# Altium schematic sheet Proj04.SchDoc
size A; SheetNumber: 1; SheetTotal: 1
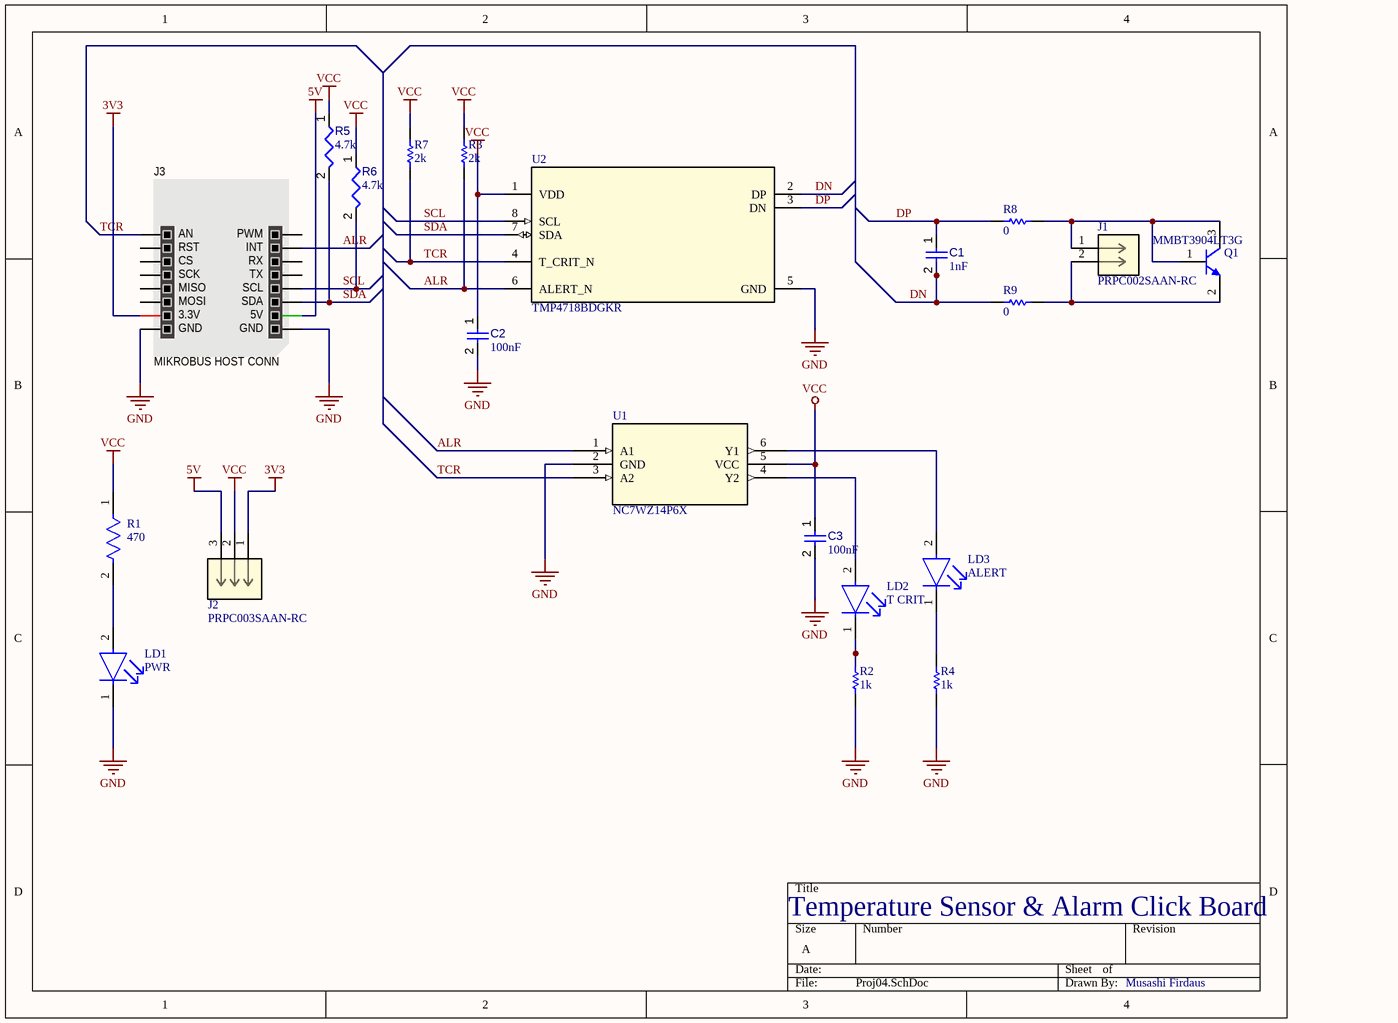
[diagram p0: Proj04.SchDoc]

## Parts
C1  value 1nF  [CAPC3216X190X55LL30T25]  (hidden comment: Capacitor 100 uF +/- 20% 6.3 V 1206)
C2  value 100nF  [CAPC3216X190X55LL30T25]  (hidden comment: Capacitor 100 uF +/- 20% 6.3 V 1206)
C3  value 100nF  [CAPC3216X190X55LL30T25]  (hidden comment: Capacitor 100 uF +/- 20% 6.3 V 1206)
J1  PRPC002SAAN-RC  [CONN_PRPC002SAAN-RC_SUL]
J2  PRPC003SAAN-RC  [CONN_PRPC003SAAN-RC_SUL]
J3  MIKROBUS HOST CONN  [MIKROBUS HOST CONN 8gen TH]
LD1  PWR  [FP-LTST-C150KRKT-MFG]
LD2  T CRIT  [FP-LTST-C150KRKT-MFG]
LD3  ALERT  [FP-LTST-C150KSKT-MFG]
Q1  MMBT3904LT3G  [ONSC-SOT-23-3-318-08_V]
R1  Resistance: 470  [FP-RMCF1206-MFG]  (hidden comment: RMCF1206JT470R)
R2  value 1k  [RESC3116X70X50ML13T20]  (hidden comment: Resistor 1k +/-1% 1206 250 mW)
R3  value 2k  [RESC3116X70X50ML13T20]  (hidden comment: Resistor 1k +/-1% 1206 250 mW)
R4  value 1k  [RESC3116X70X50ML13T20]  (hidden comment: Resistor 1k +/-1% 1206 250 mW)
R5  value 4.7k  [RESC3116X70X50ML13T20]  (hidden comment: Resistor 4k7 +/-1% 1206 250 mW)
R6  value 4.7k  [RESC3116X70X50ML13T20]  (hidden comment: Resistor 4k7 +/-1% 1206 250 mW)
R7  value 2k  [RESC3116X70X50ML13T20]  (hidden comment: Resistor 1k +/-1% 1206 250 mW)
R8  value 0  [RESC3216X60X45ML15T20]  (hidden comment: Resistor 0R +/- 5% 1206 250 mW)
R9  value 0  [RESC3216X60X45ML15T20]  (hidden comment: Resistor 0R +/- 5% 1206 250 mW)
U1  NC7WZ14P6X  [SC70-6_ONS]
U2  TMP4718BDGKR  [DGK0008A-IPC_A]

## Nets
3V3: J2.1 J3.7(3.3V)
5V: J2.3 J3.10(5V)
GND: C2.2 C3.2 J3.8(GND) J3.9(GND) LD1.1(C) R2.1 R4.1 U1.2(GND) U2.5(GND)
VCC: C2.1 C3.1 J2.2 R1.1 R3.2 R5.1 R6.1 R7.2 U1.5(VCC) U2.1(VDD)
ALR: J3.15(INT) R3.1 U1.1(A1) U2.6(ALERT_N)
DN: C1.2 R9.1 U2.2(DP)
DP: C1.1 R8.1 U2.3(DN)
SCL: J3.12(SCL) R6.2 U2.8(SCL)
SDA: J3.11(SDA) R5.2 U2.7(SDA)
TCR: J3.1(AN) R7.1 U1.3(A2) U2.4(T_CRIT_N)
NetJ1_1: J1.1 Q1.1(B) Q1.3(C) R8.2
NetJ1_2: J1.2 Q1.2(E) R9.2
NetLD1_2: LD1.2(A) R1.2
NetLD2_1: LD2.1(C) R2.2
NetLD2_2: LD2.2(A) U1.4(Y2)
NetLD3_1: LD3.1(C) R4.2
NetLD3_2: LD3.2(A) U1.6(Y1)

Not connected (* = marked no-connect by the designer): J3 2(RST) 3(CS) 4(SCK) 5(MISO) 6(MOSI) 13(TX) 14(RX) 16(PWM)

## Notes on the sheet
- Temperature Sensor & Alarm Click Board
- Musashi Firdaus

## Library data of the parts
C1-C3 = CMP-001-00019-6: Chip Capacitor, 100 uF, +/- 20%, 6.3 V, 1206 (3216 Metric); Voltage Rating: 6.3V; Capacitor Type: Ceramic; Tolerance: 20%; Pins: 2; Case/Package: 1206; Max Operating Temperature: 85°C; RoHS Compliant: True; Mounting Technology: SM; Min Operating Temperature: -55°C
J1 = PRPC002SAAN-RC: CONN HEADER .100 SNGL STR 2POS; Manufacturer_Name: Sullins; Copyright: Copyright (C) 2025 Ultra Librarian. All rights reserved.; Manufacturer_Part_Number: PRPC002SAAN-RC; RefDes: RefDes; Type: Type
J2 = PRPC003SAAN-RC: Description; Manufacturer_Name: Sullins; Copyright: Copyright (C) 2025 Ultra Librarian. All rights reserved.; Manufacturer_Part_Number: PRPC003SAAN-RC; RefDes: RefDes; Type: Type
LD1 = CMP-2000-06617-2: LED GREEN CLEAR 1206 SMD; Wavelength: 571nm; Power Dissipation: 62.5mW; Luminous Intensity: 54mcd; Test Current: 20mA; Illumination Color: Red; Forward Current: 30mA; Reverse Voltage: 5V; Viewing Angle: 130°; Number of Elements: 1; Lens Style: Diffused; Power Rating: 75mW; Lens Color: Colorless; Forward Voltage: 2V; Dominant Wavelength: 631nm; Depth: 1.6mm; Mount: Surface Mount; Packaging: Tape and Reel; Case Code (Metric): 3216; Lens Transparency: Clear; Radiation Hardening: No; Min Operating Temperature: -30°C; Height: 1.1mm; Case Code (Imperial): 1206; Number of Pins: 2; Length: 3.2mm; Lead Free: Lead Free; Color: Red; Width: 1.6mm; Number of LEDs: 1; Max Operating Temperature: 85°C; Case/Package: 1206; Package Quantity: 1
LD2 = CMP-2000-06617-2: LED RED CLEAR 1206 SMD; Wavelength: 639nm; Power Dissipation: 62.5mW; Luminous Intensity: 54mcd; Test Current: 20mA; Forward Current: 30mA; Reverse Voltage: 5V; Viewing Angle: 130°; Number of Elements: 1; Lens Style: Diffused; Power Rating: 75mW; Lens Color: Colorless; Forward Voltage: 2V; Dominant Wavelength: 631nm; Depth: 1.6mm; Mount: Surface Mount; Packaging: Tape and Reel; Case Code (Metric): 3216; Lens Transparency: Clear; Illumination Color: Red; Radiation Hardening: No; Min Operating Temperature: -30°C; Height: 1.1mm; Case Code (Imperial): 1206; Number of Pins: 2; Length: 3.2mm; Lead Free: Lead Free; Color: Red; Width: 1.6mm; Number of LEDs: 1; Max Operating Temperature: 85°C; Case/Package: 1206; Package Quantity: 1
LD3 = CMP-2000-06618-2: LED YELLOW CLEAR 1206 SMD; Power Rating: 75mW; Wavelength: 588nm; Forward Current: 30mA; Test Current: 20mA; Viewing Angle: 130°; Forward Voltage: 2.4V; Luminous Intensity: 60mcd; Lens Style: Diffused; Number of Elements: 1; Reverse Voltage: 5V; Lens Color: Colorless; Dominant Wavelength: 587nm; Mount: Surface Mount; Min Operating Temperature: -55°C; Depth: 1.6mm; Max Operating Temperature: 85°C; Color: Yellow; Power Dissipation: 75mW; Width: 1.6mm; Packaging: Tape and Reel; Length: 3.2mm; Illumination Color: Yellow; Number of Pins: 2; Case Code (Metric): 3216; Lead Free: Lead Free; Package Quantity: 1; Radiation Hardening: No; Height: 1.1mm; Case Code (Imperial): 1206; Number of LEDs: 1; Case/Package: 1206; Lens Transparency: Clear
Q1 = CMP-1048-00630-1: General Purpose Transistor, NPN Silicon, 3-Pin SOT-23, Pb-Free, Tape and Reel; Manufacturer: On Semiconductor; fT Min (MHz): 300; IC Continuous (A): 0.2; PackageVersion: Rev. AP, 11/2009; PackageReference: SOT-23-3-318-08; Packing: Tape and Reel; RoHS: TRUE; ComponentLink2Description: Datasheet; PackageDescription: 3-Pin Small Outline Transistor, Body 2.92 x 1.3 mm, Pitch 0.95 mm; PartNumber: MMBT3904LT3G; ComponentLink1Description: Manufacturer URL; ComponentLink3URL: http://www.onsemi.cn/pub_link/Collateral/318-08.PDF; Mounting Technology: Surface Mount; ComponentLink3Description: Package Specification; DatasheetVersion: Rev. 12; ComponentLink1URL: http://www.onsemi.com/; ComponentLink2URL: http://www.onsemi.cn/pub_link/Collateral/MMBT3904LT1-D.PDF; Polarity: NPN
R1 = CMP-26527-000142-1: 470Ω ±5% 0.25W 1206 Thick Film Chip Resistor AEC-Q200 compliant; Max Power Dissipation: 250mW; Temperature Coefficient: 200ppm/°C; Number of Terminations: 2; Lead Free: Lead Free; Case Code (Imperial): 1206; RoHS Compliant: Yes; Width: 0.063inch; Radiation Hardening: No; Height: 0.028inch; Contact Plating: Tin; Packaging: Tape and Reel; Size Code: 1206; Depth: 1.6mm; Series: RMCF; Min Operating Temperature: -55°C; Max Operating Temperature: 155°C; Military Standard: Not; Length: 3.2mm; Tolerance: 5%; Construction: Rectangular; Mount: Surface Mount; Power Rating: 250mW; Case Code (Metric): 3216; Case/Package: 1206; Resistor Type: Thick Film; Features: Automotive AEC-Q200
R2-R4 R7 = CMP-009-00011-5: Chip Resistor, 1 KOhm, +/- 1%, 0.25 W, -55 to 155 degC, 1206 (3216 Metric); Voltage Rating: 200V; Power: 250mW; Max Operating Temperature: 155°C; Mounting Technology: SM; Tolerance: 1%; Case/Package: 1206; RoHS Compliant: True; Min Operating Temperature: -55°C; Pins: 2
R5 R6 = CMP-009-00033-5: Chip Resistor, 4.7 KOhm, +/- 1%, 0.25 W, -55 to 155 degC, 1206 (3216 Metric); Power: 250mW; Voltage Rating: 200V; Pins: 2; Min Operating Temperature: -55°C; Max Operating Temperature: 155°C; Case/Package: 1206; Tolerance: 1%; RoHS Compliant: True; Mounting Technology: SM
R8 R9 = CMP-009-00002-5: Chip Resistor, 0 Ohm, +/- 5%, 0.25 W, -55 to 155 degC, 1206 (3216 Metric); Voltage Rating: 200V; Power: 250mW; Tolerance: 5%; Min Operating Temperature: -55°C; Mounting Technology: SM; Max Operating Temperature: 155°C; Case/Package: 1206; RoHS Compliant: True; Pins: 2
U1 = NC7WZ14P6X: Description; Manufacturer_Name: onsemi; Copyright: Copyright (C) 2026 Ultra Librarian. All rights reserved.; Manufacturer_Part_Number: NC7WZ14P6X; RefDes: RefDes; Type: Type
U2 = TMP4718BDGKR: High-accuracy remote and local temperature sensor with pin-programmable alert thresholds 8-VSSOP -40 to 125; Manufacturer_Name: Texas Instruments; TYPE: TYPE; RefDes: RefDes; Copyright: Copyright (C) 2026 Ultra Librarian. All rights reserved.; Manufacturer_Part_Number: TMP4718BDGKR